# Altium schematic sheet BMC096C.schdoc (part 2 of 3)
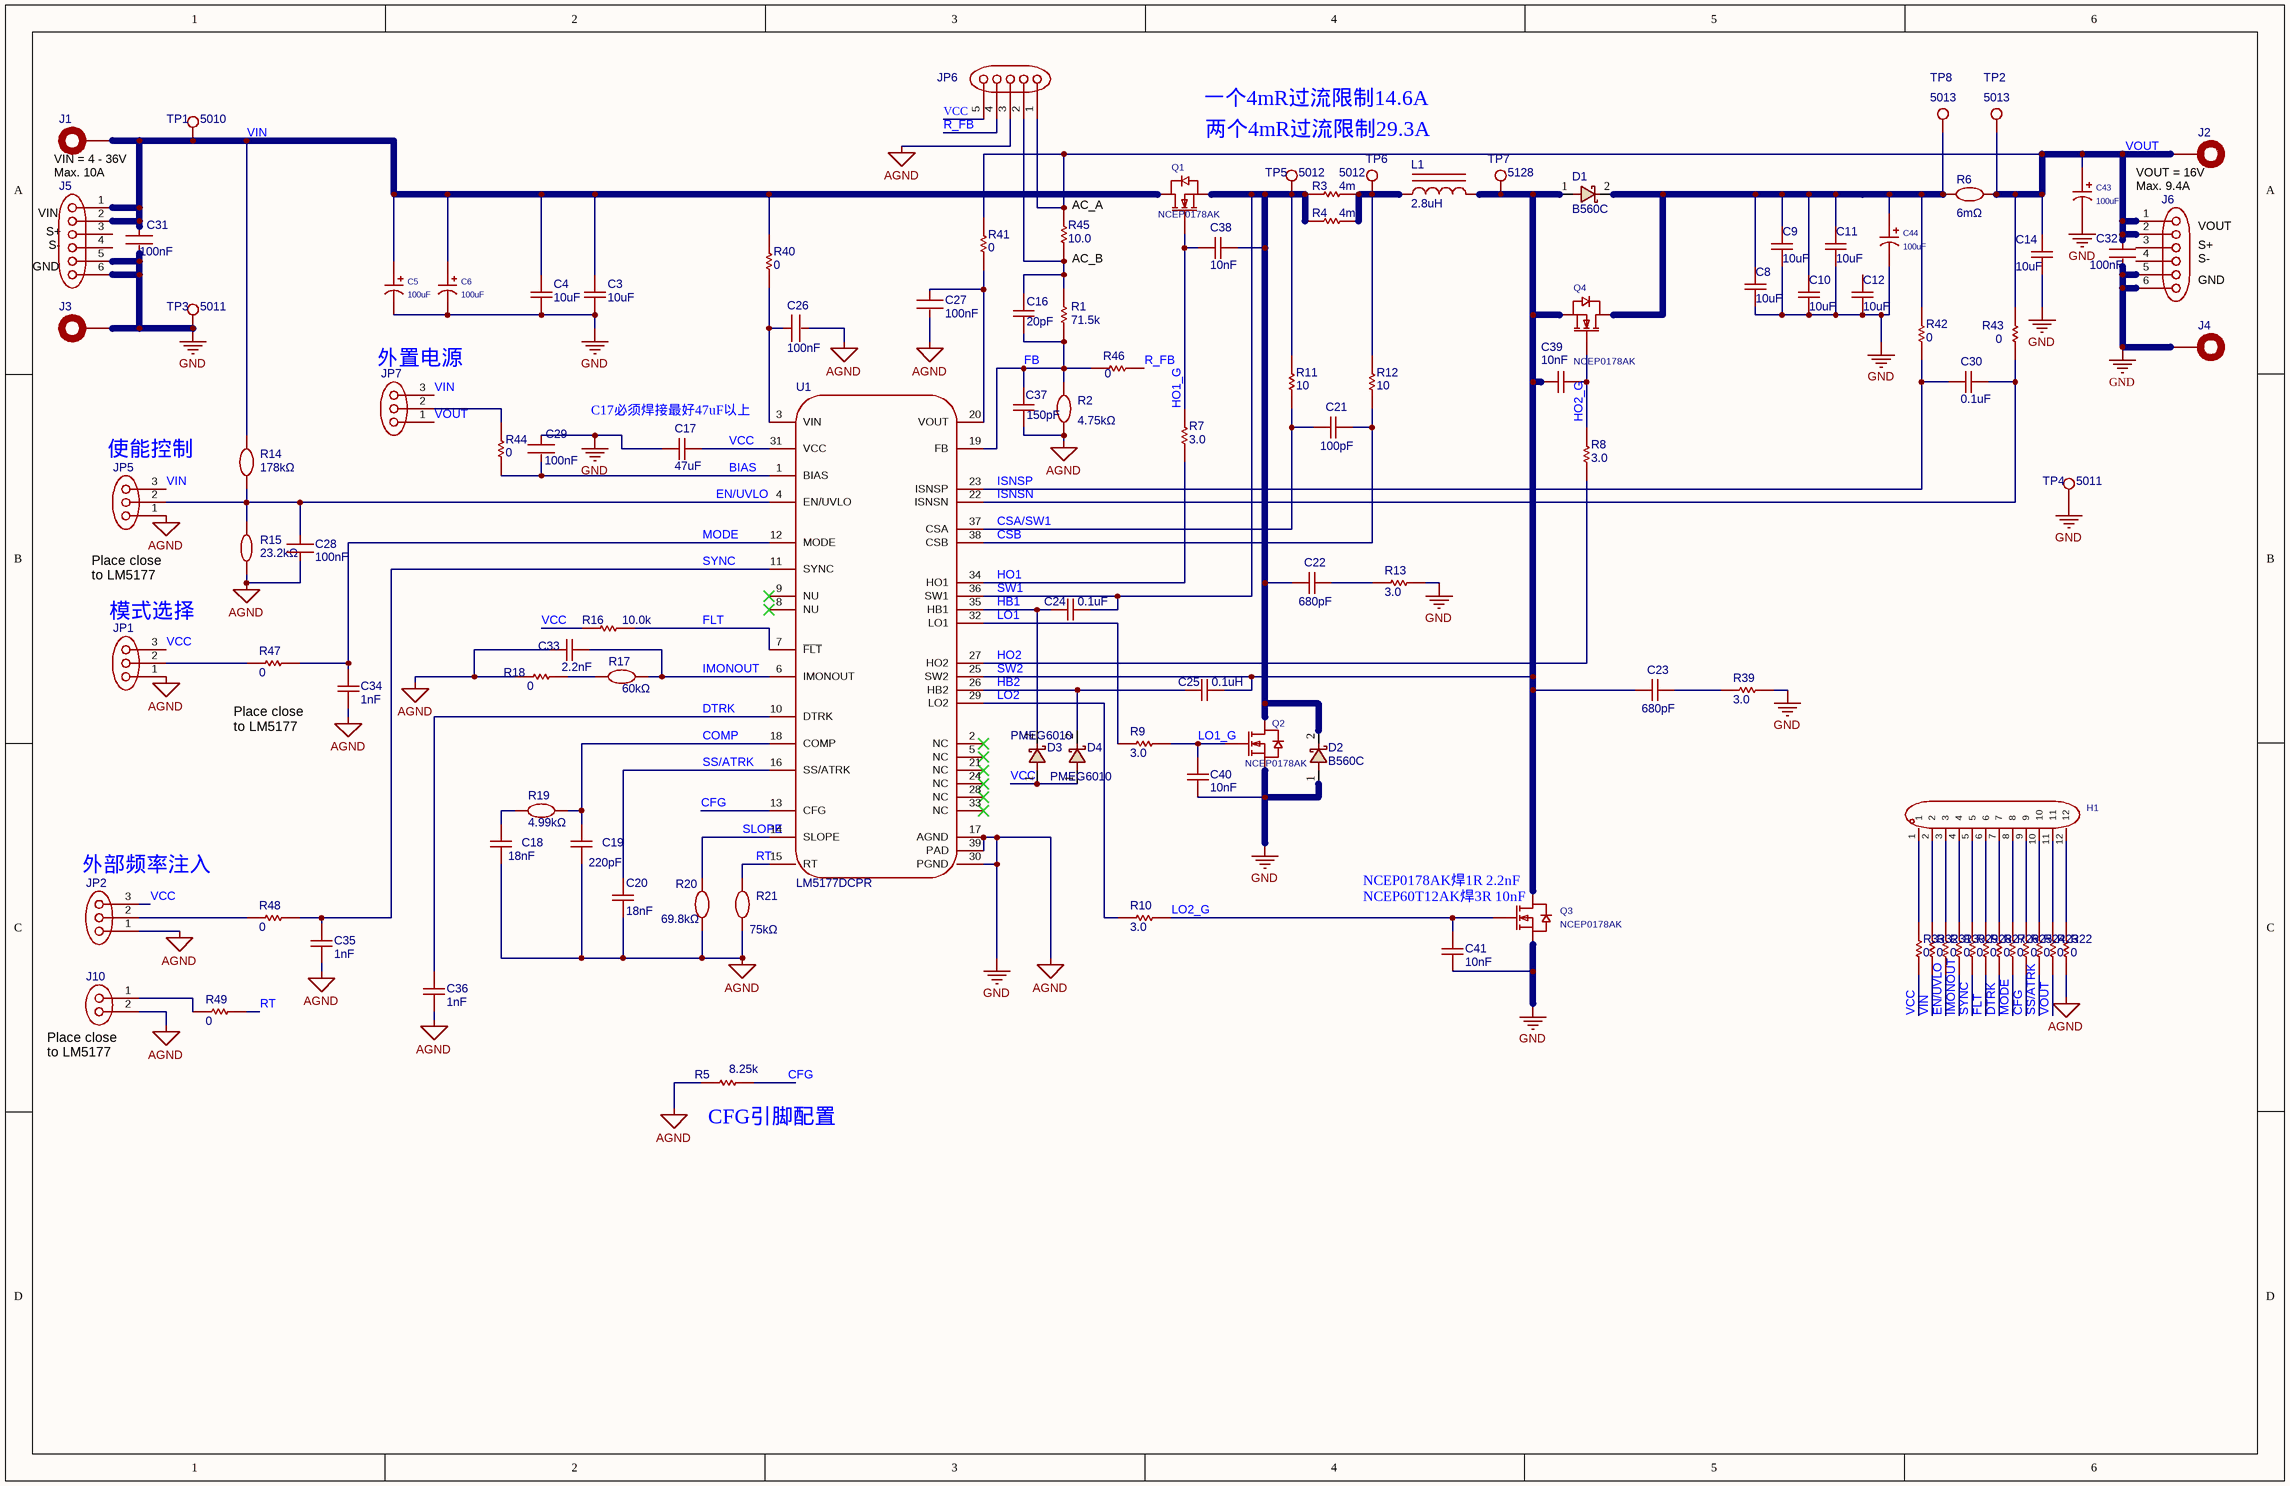
[diagram p1: BMC096C.schdoc]
## Library data of the parts
C3 = CMP-0092251-1: Ceramic Capacitor for Automotive 10uF -10% 50VDC X7S 1210 Embossed T/R; Manufacturer: Murata; AEC Grade: Grade 1; TempCo: 22%; AEC Qualified: Yes; VDC_V: 50V; Cap_F: 10礔; Tolerance_%: 10%; SizeZ_mm: 2.7mm; Value: 10礔; Origin Footprint: FP-GCM32EC71H106KA03L_1210-IPC_C; OriginFootprint 2: FP-GCM32EC71H106KA03L_1210-IPC_B; OriginFootprint 3: FP-GCM32EC71H106KA03L_1210-IPC_A; UniqueId: cc82bf2c2e22e605; OriginModelName: Cap_GCM32EC71H106KA03L_1210; Device: CMP-0092251-1; Symbol: CMP-0092251-1; RoHS: TRUE; ComponentLink1URL: https://www.murata.com/en-us/products/productdetail?partno=GCM32EC71H106KA03%23; Temperature Characteristic: X7S; Part Number: GCM32EC71H106KA03L; PackageReference: 1210; datasheet: https://www.murata.com/en-us/products/productdetail?partno=GCM32EC71H106KA03%23; ComponentLink1Description: Datasheet; helpURL: https://upverter.com/upn/revision/edd6109eef88ffd0/; Operating Temperature Range: -55癈 to +125癈; Datasheet Path: datasheets/Cap-GCM32EC71H106KA03L.pdf; Lead Free: Yes; PartNumber: GCM32EC71H106KA03L; DesignItemID: CMP-0092251-1; LibraryName: Altium Vault - TI; FootprintName: FP-GCM32EC71H106KA03L_1210-MFG; AddInBom: yes
C4 = CMP-0092251-1: Ceramic Capacitor for Automotive 10uF -10% 50VDC X7S 1210 Embossed T/R; Manufacturer: Murata; AEC Grade: Grade 1; TempCo: 22%; AEC Qualified: Yes; VDC_V: 50V; Cap_F: 10礔; Tolerance_%: 10%; SizeZ_mm: 2.7mm; Value: 10礔; Origin Footprint: FP-GCM32EC71H106KA03L_1210-IPC_C; OriginFootprint 2: FP-GCM32EC71H106KA03L_1210-IPC_B; OriginFootprint 3: FP-GCM32EC71H106KA03L_1210-IPC_A; UniqueId: 3a68d3ddabf48558; OriginModelName: Cap_GCM32EC71H106KA03L_1210; Device: CMP-0092251-1; Symbol: CMP-0092251-1; RoHS: TRUE; ComponentLink1URL: https://www.murata.com/en-us/products/productdetail?partno=GCM32EC71H106KA03%23; Temperature Characteristic: X7S; Part Number: GCM32EC71H106KA03L; PackageReference: 1210; datasheet: https://www.murata.com/en-us/products/productdetail?partno=GCM32EC71H106KA03%23; ComponentLink1Description: Datasheet; helpURL: https://upverter.com/upn/revision/edd6109eef88ffd0/; Operating Temperature Range: -55癈 to +125癈; Datasheet Path: datasheets/Cap-GCM32EC71H106KA03L.pdf; Lead Free: Yes; PartNumber: GCM32EC71H106KA03L; DesignItemID: CMP-0092251-1; LibraryName: Altium Vault - TI; FootprintName: FP-GCM32EC71H106KA03L_1210-MFG; AddInBom: yes
C5 C6 = MA63V100M10X10: 容值:100uF;精度:±20%;额定电压:63V;纹波电流:3.1A@100kHz;等效串联电阻(ESR):30mΩ@100kHz;类型:聚合物;; Manufacturer: JIERR(捷而瑞); Tolerance: ±20%; Voltage Rating: 63V; Type: 聚合物; Lifetime: 2000hrs@105℃; Polarity type: 有极性; AddInBom: yes; Symbol: MA63V100M10X10; Device: MA63V100M10X10; LCSC Part Name: 100uF ±20% 63V; Supplier Part: C54321630; Manufacturer Part: MA63V100M10X10; Supplier Footprint: SMD,D10.3xL10.5mm; JLCPCB Part Class: Extended Part; Datasheet: https://item.szlcsc.com/datasheet/MA63V100M10X10/57612373.html; Supplier: LCSC; Value: 100uF; Ripple Current: 3.1A@100kHz; Equivalent Series Resistance(ESR): 30mΩ@100kHz; Diameter: 10mm; Height - Seated (Max): 10mm; Operating Temperature: -55℃~+105℃; ConvertToPcb: yes; FootprintName: CAP-SMD_BD10.0-L10.3-W10.3-LS11.6-FD_H10.5
C8 = CMP-0092251-1: Ceramic Capacitor for Automotive 10uF -10% 50VDC X7S 1210 Embossed T/R; Manufacturer: Murata; AEC Grade: Grade 1; TempCo: 22%; AEC Qualified: Yes; VDC_V: 50V; Cap_F: 10礔; Tolerance_%: 10%; SizeZ_mm: 2.7mm; Value: 10礔; Origin Footprint: FP-GCM32EC71H106KA03L_1210-IPC_C; OriginFootprint 2: FP-GCM32EC71H106KA03L_1210-IPC_B; OriginFootprint 3: FP-GCM32EC71H106KA03L_1210-IPC_A; UniqueId: 80f3708378e3d903; OriginModelName: Cap_GCM32EC71H106KA03L_1210; Device: CMP-0092251-1; Symbol: CMP-0092251-1; RoHS: TRUE; ComponentLink1URL: https://www.murata.com/en-us/products/productdetail?partno=GCM32EC71H106KA03%23; Temperature Characteristic: X7S; Part Number: GCM32EC71H106KA03L; PackageReference: 1210; datasheet: https://www.murata.com/en-us/products/productdetail?partno=GCM32EC71H106KA03%23; ComponentLink1Description: Datasheet; helpURL: https://upverter.com/upn/revision/edd6109eef88ffd0/; Operating Temperature Range: -55癈 to +125癈; Datasheet Path: datasheets/Cap-GCM32EC71H106KA03L.pdf; Lead Free: Yes; PartNumber: GCM32EC71H106KA03L; DesignItemID: CMP-0092251-1; LibraryName: Altium Vault - TI; FootprintName: FP-GCM32EC71H106KA03L_1210-MFG; AddInBom: yes
C9 = CMP-0092251-1: Ceramic Capacitor for Automotive 10uF -10% 50VDC X7S 1210 Embossed T/R; Manufacturer: Murata; AEC Grade: Grade 1; TempCo: 22%; AEC Qualified: Yes; VDC_V: 50V; Cap_F: 10礔; Tolerance_%: 10%; SizeZ_mm: 2.7mm; Value: 10礔; Origin Footprint: FP-GCM32EC71H106KA03L_1210-IPC_C; OriginFootprint 2: FP-GCM32EC71H106KA03L_1210-IPC_B; OriginFootprint 3: FP-GCM32EC71H106KA03L_1210-IPC_A; UniqueId: 7ddfd2f632a8b17d; OriginModelName: Cap_GCM32EC71H106KA03L_1210; Device: CMP-0092251-1; Symbol: CMP-0092251-1; RoHS: TRUE; ComponentLink1URL: https://www.murata.com/en-us/products/productdetail?partno=GCM32EC71H106KA03%23; Temperature Characteristic: X7S; Part Number: GCM32EC71H106KA03L; PackageReference: 1210; datasheet: https://www.murata.com/en-us/products/productdetail?partno=GCM32EC71H106KA03%23; ComponentLink1Description: Datasheet; helpURL: https://upverter.com/upn/revision/edd6109eef88ffd0/; Operating Temperature Range: -55癈 to +125癈; Datasheet Path: datasheets/Cap-GCM32EC71H106KA03L.pdf; Lead Free: Yes; PartNumber: GCM32EC71H106KA03L; DesignItemID: CMP-0092251-1; LibraryName: Altium Vault - TI; FootprintName: FP-GCM32EC71H106KA03L_1210-MFG; AddInBom: yes
C10 = CMP-0092251-1: Ceramic Capacitor for Automotive 10uF -10% 50VDC X7S 1210 Embossed T/R; Manufacturer: Murata; AEC Grade: Grade 1; TempCo: 22%; AEC Qualified: Yes; VDC_V: 50V; Cap_F: 10礔; Tolerance_%: 10%; SizeZ_mm: 2.7mm; Value: 10礔; Origin Footprint: FP-GCM32EC71H106KA03L_1210-IPC_C; OriginFootprint 2: FP-GCM32EC71H106KA03L_1210-IPC_B; OriginFootprint 3: FP-GCM32EC71H106KA03L_1210-IPC_A; UniqueId: 3e75135af30e0f04; OriginModelName: Cap_GCM32EC71H106KA03L_1210; Device: CMP-0092251-1; Symbol: CMP-0092251-1; RoHS: TRUE; ComponentLink1URL: https://www.murata.com/en-us/products/productdetail?partno=GCM32EC71H106KA03%23; Temperature Characteristic: X7S; Part Number: GCM32EC71H106KA03L; PackageReference: 1210; datasheet: https://www.murata.com/en-us/products/productdetail?partno=GCM32EC71H106KA03%23; ComponentLink1Description: Datasheet; helpURL: https://upverter.com/upn/revision/edd6109eef88ffd0/; Operating Temperature Range: -55癈 to +125癈; Datasheet Path: datasheets/Cap-GCM32EC71H106KA03L.pdf; Lead Free: Yes; PartNumber: GCM32EC71H106KA03L; DesignItemID: CMP-0092251-1; LibraryName: Altium Vault - TI; FootprintName: FP-GCM32EC71H106KA03L_1210-MFG; AddInBom: yes
C11 = CMP-0092251-1: Ceramic Capacitor for Automotive 10uF -10% 50VDC X7S 1210 Embossed T/R; Manufacturer: Murata; AEC Grade: Grade 1; TempCo: 22%; AEC Qualified: Yes; VDC_V: 50V; Cap_F: 10礔; Tolerance_%: 10%; SizeZ_mm: 2.7mm; Value: 10礔; Origin Footprint: FP-GCM32EC71H106KA03L_1210-IPC_C; OriginFootprint 2: FP-GCM32EC71H106KA03L_1210-IPC_B; OriginFootprint 3: FP-GCM32EC71H106KA03L_1210-IPC_A; UniqueId: 20764de07767b3a1; OriginModelName: Cap_GCM32EC71H106KA03L_1210; Device: CMP-0092251-1; Symbol: CMP-0092251-1; RoHS: TRUE; ComponentLink1URL: https://www.murata.com/en-us/products/productdetail?partno=GCM32EC71H106KA03%23; Temperature Characteristic: X7S; Part Number: GCM32EC71H106KA03L; PackageReference: 1210; datasheet: https://www.murata.com/en-us/products/productdetail?partno=GCM32EC71H106KA03%23; ComponentLink1Description: Datasheet; helpURL: https://upverter.com/upn/revision/edd6109eef88ffd0/; Operating Temperature Range: -55癈 to +125癈; Datasheet Path: datasheets/Cap-GCM32EC71H106KA03L.pdf; Lead Free: Yes; PartNumber: GCM32EC71H106KA03L; DesignItemID: CMP-0092251-1; LibraryName: Altium Vault - TI; FootprintName: FP-GCM32EC71H106KA03L_1210-MFG; AddInBom: yes
C12 = CMP-0092251-1: Ceramic Capacitor for Automotive 10uF -10% 50VDC X7S 1210 Embossed T/R; Manufacturer: Murata; AEC Grade: Grade 1; TempCo: 22%; AEC Qualified: Yes; VDC_V: 50V; Cap_F: 10礔; Tolerance_%: 10%; SizeZ_mm: 2.7mm; Value: 10礔; Origin Footprint: FP-GCM32EC71H106KA03L_1210-IPC_C; OriginFootprint 2: FP-GCM32EC71H106KA03L_1210-IPC_B; OriginFootprint 3: FP-GCM32EC71H106KA03L_1210-IPC_A; UniqueId: 26a39bcafcc8ce7c; OriginModelName: Cap_GCM32EC71H106KA03L_1210; Device: CMP-0092251-1; Symbol: CMP-0092251-1; RoHS: TRUE; ComponentLink1URL: https://www.murata.com/en-us/products/productdetail?partno=GCM32EC71H106KA03%23; Temperature Characteristic: X7S; Part Number: GCM32EC71H106KA03L; PackageReference: 1210; datasheet: https://www.murata.com/en-us/products/productdetail?partno=GCM32EC71H106KA03%23; ComponentLink1Description: Datasheet; helpURL: https://upverter.com/upn/revision/edd6109eef88ffd0/; Operating Temperature Range: -55癈 to +125癈; Datasheet Path: datasheets/Cap-GCM32EC71H106KA03L.pdf; Lead Free: Yes; PartNumber: GCM32EC71H106KA03L; DesignItemID: CMP-0092251-1; LibraryName: Altium Vault - TI; FootprintName: FP-GCM32EC71H106KA03L_1210-MFG; AddInBom: yes
C14 = CMP-0092251-1: Ceramic Capacitor for Automotive 10uF -10% 50VDC X7S 1210 Embossed T/R; Manufacturer: Murata; AEC Grade: Grade 1; TempCo: 22%; AEC Qualified: Yes; VDC_V: 50V; Cap_F: 10礔; Tolerance_%: 10%; SizeZ_mm: 2.7mm; Value: 10礔; Origin Footprint: FP-GCM32EC71H106KA03L_1210-IPC_C; OriginFootprint 2: FP-GCM32EC71H106KA03L_1210-IPC_B; OriginFootprint 3: FP-GCM32EC71H106KA03L_1210-IPC_A; UniqueId: 00361082df9d4549; OriginModelName: Cap_GCM32EC71H106KA03L_1210; Device: CMP-0092251-1; Symbol: CMP-0092251-1; RoHS: TRUE; ComponentLink1URL: https://www.murata.com/en-us/products/productdetail?partno=GCM32EC71H106KA03%23; Temperature Characteristic: X7S; Part Number: GCM32EC71H106KA03L; PackageReference: 1210; datasheet: https://www.murata.com/en-us/products/productdetail?partno=GCM32EC71H106KA03%23; ComponentLink1Description: Datasheet; helpURL: https://upverter.com/upn/revision/edd6109eef88ffd0/; Operating Temperature Range: -55癈 to +125癈; Datasheet Path: datasheets/Cap-GCM32EC71H106KA03L.pdf; Lead Free: Yes; PartNumber: GCM32EC71H106KA03L; DesignItemID: CMP-0092251-1; LibraryName: Altium Vault - TI; FootprintName: FP-GCM32EC71H106KA03L_1210-MFG; AddInBom: yes
C16 = CMP-0007253-4: CAP, CERM, 20 pF, 100 V, +/- 5%, C0G/NP0, 0603; Manufacturer: MuRata; TaMin_C: -55癈; Polarized: N; SizeAreaWB_mm2: 4.68; Value1: Unknown; U/M: EA; Value: 20pF; TaMax_C: 125癈; SizeZ_mm: 1; SizeX_mm: 1.6; SizeY_mm: 0.8; Cap_Case: 0603; Value2: 100V; SizeArea_mm2: 1.28; CompType: Capacitor; AEC Category: Q200; OriginFootprint 2: 0603_HV; OriginFootprint 3: 0603L; OriginFootprint 4: 0603M; UniqueId: c8e923f96b539988; AddInBom: yes; Device: CMP-0007253-4; Symbol: CMP-0007253-4; Supplier Part Number 2: 81-GRM1885C2A200JA1D; Publisher: Texas Instruments; Supplier 2: Mouser; TempCo: C0G/NP0; Published: 2008-06-19; RoHS: Y; MountType: SMT; Supplier 1: Digi-Key; PackageReference: 0603; Tolerance_%: 5%; LatestRevisionDate: 2017-03-09; PartNumber: GRM1885C2A200JA01D; AEC Qualified: ?; Cap_F: 20pF; VDC_V: 100V; ComponentLink1Description: Datasheet link; Supplier Part Number 1: 490-1334-1-ND; Technology: Ceramic; ComponentLink1URL: http://search.murata.co.jp/Ceramy/PnsearchViewAction.do?HnOFG=ON&HnNFG=ON&SEL_CNT=50&sLang=en&sKey=GRM1885C2A200JA01D&x=9&y=9&search=startwith; Origin Footprint: 0603; DesignItemID: CMP-0007253-4; LibraryName: Altium Vault - TI; FootprintName: 0603S
C17 = CMP-0007313-5: CAP, CERM, 47 uF, 6.3 V, +/- 20%, X5R, 0603; Manufacturer: MuRata; TaMin_C: -55癈; Polarized: N; SizeAreaWB_mm2: 4.68; Value1: Unknown; U/M: EA; Value: 47uF; TaMax_C: 85癈; SizeZ_mm: 1; SizeX_mm: 1.6; SizeY_mm: 0.8; Cap_Case: 0603; Value2: 6.3V; SizeArea_mm2: 1.28; CompType: Capacitor; Cap_F: 47礔; AEC Category: Q200; OriginFootprint 2: 0603_HV; OriginFootprint 3: 0603L; OriginFootprint 4: 0603M; UniqueId: 48700c84863a802e; AddInBom: yes; Device: CMP-0007313-5; Symbol: CMP-0007313-5; Publisher: Texas Instruments; TempCo: X5R; Published: 2008-06-19; RoHS: Y; MountType: SMT; PackageReference: 0603; Tolerance_%: 20%; LatestRevisionDate: 2017-03-09; PartNumber: GRM188R60J476ME15D; AEC Qualified: ?; VDC_V: 6.3V; ComponentLink1Description: Datasheet link; Technology: Ceramic; ComponentLink1URL: http://psearch.en.murata.com/capacitor/product/GRM188R60J476ME15%23.pdf; Origin Footprint: 0603; DesignItemID: CMP-0007313-5; LibraryName: Altium Vault - TI; FootprintName: 0603S
C18 = CC0603KRX7R9BB183: 容值:18nF;精度:±10%;额定电压:50V;温度系数:X7R;; Manufacturer: YAGEO(国巨); Add into BOM: yes; 3D Model: ac125912035d415993ca9572d50418b1; 3D Model Transform: 62.992,31.496,0,0,0,0,0,0,0; Tolerance: ±10%; Voltage Rating: 50V; Temperature Coefficient: X7R; ModelName: C0603_L1.6-W0.8-H0.8; Symbol: CC0603KRX7R9BB183; Device: CC0603KRX7R9BB183; Convert to PCB: yes; Value: 18nF; LCSC Part Name: 18nF ±10% 50V; Supplier Part: C107079; Manufacturer Part: CC0603KRX7R9BB183; Supplier Footprint: 0603; JLCPCB Part Class: Extended Part; Datasheet: https://item.szlcsc.com/datasheet/CC0603KRX7R9BB183/108295.html; Supplier: LCSC; FootprintName: C0603
C19 = CC0603JRNPO9BN221: 容值:220pF;精度:±5%;额定电压:50V;温度系数:NP0;; Manufacturer: YAGEO(国巨); Add into BOM: yes; 3D Model: ac125912035d415993ca9572d50418b1; 3D Model Transform: 62.992,31.496,0,0,0,0,0,0,0; Tolerance: ±5%; Voltage Rating: 50V; Temperature Coefficient: NP0; ModelName: C0603_L1.6-W0.8-H0.8; Symbol: CC0603JRNPO9BN221; Device: CC0603JRNPO9BN221; Convert to PCB: yes; Value: 220pF; LCSC Part Name: 220pF ±5% 50V; Supplier Part: C106210; Manufacturer Part: CC0603JRNPO9BN221; Supplier Footprint: 0603; JLCPCB Part Class: Extended Part; Datasheet: https://item.szlcsc.com/datasheet/CC0603JRNPO9BN221/107425.html; Supplier: LCSC; FootprintName: C0603
C20 = CMP-0092440-1: Ceramic Capacitor for Automotive 18nF -5% 50VDC C0G 0805 Embossed T/R; Manufacturer: Murata; TempCo: 30ppm/癈; AEC Qualified: Yes; Tolerance_%: 5%; AEC Grade: Grade 1; VDC_V: 50V; SizeZ_mm: 1.4mm; Origin Footprint: FP-GCM21B5C1H183JA16L_0805-IPC_C; OriginFootprint 2: FP-GCM21B5C1H183JA16L_0805-IPC_B; OriginFootprint 3: FP-GCM21B5C1H183JA16L_0805-IPC_A; UniqueId: 97d7532320e593d5; OriginModelName: Cap_GCM21B5C1H183JA16L_0805; Device: CMP-0092440-1; Symbol: CMP-0092440-1; Operating Temperature Range: -55癈 to +125癈; ComponentLink1URL: https://www.murata.com/en-us/products/productdetail?partno=GCM21B5C1H183JA16%23; datasheet: https://www.murata.com/en-us/products/productdetail?partno=GCM21B5C1H183JA16%23; PackageReference: 0805; PartNumber: GCM21B5C1H183JA16L; Part Number: GCM21B5C1H183JA16L; Temperature Characteristic: C0G; ComponentLink1Description: Datasheet; RoHS: TRUE; Cap_F: 18nF; Value: 18nF; Lead Free: Yes; Datasheet Path: datasheets/Cap-GCM21B5C1H183JA16L.pdf; helpURL: https://upverter.com/upn/revision/286cb77b29c01871/; DesignItemID: CMP-0092440-1; LibraryName: Altium Vault - TI; FootprintName: FP-GCM21B5C1H183JA16L_0805-MFG; AddInBom: yes
C21 = CMP-0750041-1: CAP, CERM, 100 pF, 50 V,+/- 5%, C0G/NP0, AEC-Q200 Grade 1, 0603; Manufacturer: MuRata; AEC Grade: 1; SizeArea_mm2: 1.28; SizeX_mm: 1.6; Polarized: N; Cap_Case: 0603; TaMax_C: 125癈; Value2: 50V; Value: 100pF; U/M: EA; CompType: Capacitor; AEC Qualified: Y; SizeAreaWB_mm2: 4.68; TaMin_C: -55癈; SizeY_mm: 0.8; AEC Category: Q200; OriginFootprint 2: 0603M; OriginFootprint 3: 0603L; OriginFootprint 4: 0603_HV; UniqueId: 0259cc883dd91c7a; AddInBom: yes; Device: CMP-0750041-1; Symbol: CMP-0750041-1; SizeZ_mm: 1; TempCo: C0G/NP0; PackageReference: 0603; Tolerance_%: 5%; VDC_V: 50V; Technology: Ceramic; MountType: SMT; RoHS: Y; ComponentLink1Description: Datasheet link; ComponentLink1URL: https://psearch.en.murata.com/capacitor/product/GCM1885C1H101JA16%23.pdf; Cap_F: 100pF; PartNumber: GCM1885C1H101JA16J; Origin Footprint: 0603; DesignItemID: CMP-0750041-1; LibraryName: Altium Vault - TI; FootprintName: 0603S
C22 = CMP-0008089-2: CAP, CERM, 680 pF, 50 V, +/- 5%, C0G/NP0, 0805; Manufacturer: MuRata; TaMin_C: -55癈; Polarized: N; SizeAreaWB_mm2: 6.75; Value1: Unknown; U/M: EA; Value: 680pF; TaMax_C: 125癈; SizeZ_mm: 1.45; SizeX_mm: 2; SizeY_mm: 1.25; Cap_Case: 0805; Value2: 50V; SizeArea_mm2: 2.5; CompType: Capacitor; AEC Category: Q200; Origin Footprint: 0805_HV; OriginFootprint 2: 0805M; OriginFootprint 4: 0805L; UniqueId: 7f35450ac3171d20; AddInBom: yes; Device: CMP-0008089-2; Symbol: CMP-0008089-2; Supplier Part Number 2: 81-GRM40C681J50D; Publisher: Texas Instruments; Supplier 2: Mouser; TempCo: C0G/NP0; Published: 2008-06-19; RoHS: Y; MountType: SMT; Supplier 1: Digi-Key; PackageReference: 0805; Tolerance_%: 5%; LatestRevisionDate: 2017-03-09; PartNumber: GRM2165C1H681JA01D; AEC Qualified: ?; Cap_F: 680pF; VDC_V: 50V; ComponentLink1Description: Datasheet link; Supplier Part Number 1: 490-1619-1-ND; Technology: Ceramic; ComponentLink1URL: http://search.murata.co.jp/Ceramy/PnsearchViewAction.do?HnOFG=ON&HnNFG=ON&SEL_CNT=50&sLang=en&sKey=GRM2165C1H681JA01D&x=9&y=9&search=startwith; OriginFootprint 3: 0805; DesignItemID: CMP-0008089-2; LibraryName: Altium Vault - TI; FootprintName: 0805_HV1
C23 = CMP-0008089-2: CAP, CERM, 680 pF, 50 V, +/- 5%, C0G/NP0, 0805; Manufacturer: MuRata; TaMin_C: -55癈; Polarized: N; SizeAreaWB_mm2: 6.75; Value1: Unknown; U/M: EA; Value: 680pF; TaMax_C: 125癈; SizeZ_mm: 1.45; SizeX_mm: 2; SizeY_mm: 1.25; Cap_Case: 0805; Value2: 50V; SizeArea_mm2: 2.5; CompType: Capacitor; AEC Category: Q200; Origin Footprint: 0805_HV; OriginFootprint 2: 0805M; OriginFootprint 4: 0805L; UniqueId: 8bc5c1e1749a19fa; AddInBom: yes; Device: CMP-0008089-2; Symbol: CMP-0008089-2; Supplier Part Number 2: 81-GRM40C681J50D; Publisher: Texas Instruments; Supplier 2: Mouser; TempCo: C0G/NP0; Published: 2008-06-19; RoHS: Y; MountType: SMT; Supplier 1: Digi-Key; PackageReference: 0805; Tolerance_%: 5%; LatestRevisionDate: 2017-03-09; PartNumber: GRM2165C1H681JA01D; AEC Qualified: ?; Cap_F: 680pF; VDC_V: 50V; ComponentLink1Description: Datasheet link; Supplier Part Number 1: 490-1619-1-ND; Technology: Ceramic; ComponentLink1URL: http://search.murata.co.jp/Ceramy/PnsearchViewAction.do?HnOFG=ON&HnNFG=ON&SEL_CNT=50&sLang=en&sKey=GRM2165C1H681JA01D&x=9&y=9&search=startwith; OriginFootprint 3: 0805; DesignItemID: CMP-0008089-2; LibraryName: Altium Vault - TI; FootprintName: 0805_HV1
C24 = CMP-0860983-1: CAP, CERM, 0.1 礔, 50 V,+/- 10%, X7R, 0402; Manufacturer: Passive Plus; Cap_Case: 0402; TaMax_C: 125癈; VDC_V: 50V; U/M: EA; CompType: Capacitor; SizeY_mm: 0.5; TaMin_C: -55癈; SizeAreaWB_mm2: 3; Value: 0.1uF; AEC Qualified: N; SizeX_mm: 1; AEC Category: Q200; SizeZ_mm: 0.6; Cap_F: 100nF; OriginFootprint 2: 0402M; OriginFootprint 3: 0402L; UniqueId: 7c674fedd66d7165; AddInBom: yes; Device: CMP-0860983-1; Symbol: CMP-0860983-1; RoHS: Y; PackageReference: 0402; AEC Grade: N/A; Technology: Ceramic; TempCo: X7R; ComponentLink1Description: Datasheet link; PartNumber: 0402BB104KW500; SizeArea_mm2: 0.5; MountType: SMT; Tolerance_%: 10%; ComponentLink1URL: https://www.passiveplus.com/pdf/PPI-0402BB104-KW500.DATASHEET.pdf; Polarized: N; Value2: 50V; Origin Footprint: 0402; DesignItemID: CMP-0860983-1; LibraryName: Altium Vault - TI; FootprintName: 0402S
C25 = CMP-0860983-1: CAP, CERM, 0.1 uF, 50 V,+/- 10%, X7R, 0402; Manufacturer: Passive Plus; Cap_Case: 0402; TaMax_C: 125癈; VDC_V: 50V; U/M: EA; CompType: Capacitor; SizeY_mm: 0.5; TaMin_C: -55癈; SizeAreaWB_mm2: 3; Value: 0.1uF; AEC Qualified: N; SizeX_mm: 1; AEC Category: Q200; SizeZ_mm: 0.6; Cap_F: 100nF; OriginFootprint 2: 0402M; OriginFootprint 3: 0402L; UniqueId: d99985aa138ce050; AddInBom: yes; Device: CMP-0860983-1; Symbol: CMP-0860983-1; RoHS: Y; PackageReference: 0402; AEC Grade: N/A; Technology: Ceramic; TempCo: X7R; ComponentLink1Description: Datasheet link; PartNumber: 0402BB104KW500; SizeArea_mm2: 0.5; MountType: SMT; Tolerance_%: 10%; ComponentLink1URL: https://www.passiveplus.com/pdf/PPI-0402BB104-KW500.DATASHEET.pdf; Polarized: N; Value2: 50V; Origin Footprint: 0402; DesignItemID: CMP-0860983-1; LibraryName: Altium Vault - TI; FootprintName: 0402S
C26 C27 = CMP-0086535-1: 0.1uF -10% 50V Ceramic Capacitor X8L 0603 (1608 Metric); Manufacturer: Murata Electronics North America; Symbol Name: SYM-GCM188L81H104KA57D; Tolerance_%: 10%; AEC Qualified: Yes; TempCo: -40+15%; SizeZ_mm: 0.9mm; AEC Grade: Grade 0; Origin Footprint: FP-GCM188L81H104KA57D_0603-IPC_C; OriginFootprint 2: FP-GCM188L81H104KA57D_0603-IPC_B; OriginFootprint 3: FP-GCM188L81H104KA57D_0603-IPC_A; UniqueId: b4693cfd16d534cd; OriginModelName: Cap_GCM188L81H104KA57D_0603; Device: CMP-0086535-1; Symbol: CMP-0086535-1; RoHS: TRUE; PackageReference: 0603; ComponentLink1URL: https://search.murata.co.jp/Ceramy/image/img/A01X/G101/ENG/GCM188L81H104KA57-01.pdf; PartNumber: GCM188L81H104KA57D; ComponentLink1Description: Datasheet; VDC_V: 50V; DesignItemID: CMP-0086535-1; LibraryName: Altium Vault - TI; FootprintName: FP-GCM188L81H104KA57D_0603-MFG; AddInBom: yes
C28 = CMP-0086535-1: 0.1礔 -10% 50V Ceramic Capacitor X8L 0603 (1608 Metric); Manufacturer: Murata Electronics North America; Symbol Name: SYM-GCM188L81H104KA57D; Tolerance_%: 10%; AEC Qualified: Yes; TempCo: -40+15%; SizeZ_mm: 0.9mm; AEC Grade: Grade 0; Origin Footprint: FP-GCM188L81H104KA57D_0603-IPC_C; OriginFootprint 2: FP-GCM188L81H104KA57D_0603-IPC_B; OriginFootprint 3: FP-GCM188L81H104KA57D_0603-IPC_A; UniqueId: e3aeb17489c0ab5d; OriginModelName: Cap_GCM188L81H104KA57D_0603; Device: CMP-0086535-1; Symbol: CMP-0086535-1; RoHS: TRUE; PackageReference: 0603; ComponentLink1URL: https://search.murata.co.jp/Ceramy/image/img/A01X/G101/ENG/GCM188L81H104KA57-01.pdf; PartNumber: GCM188L81H104KA57D; ComponentLink1Description: Datasheet; VDC_V: 50V; DesignItemID: CMP-0086535-1; LibraryName: Altium Vault - TI; FootprintName: FP-GCM188L81H104KA57D_0603-MFG; AddInBom: yes
C29 = CMP-0086535-1: 0.1礔 -10% 50V Ceramic Capacitor X8L 0603 (1608 Metric); Manufacturer: Murata Electronics North America; Symbol Name: SYM-GCM188L81H104KA57D; Tolerance_%: 10%; AEC Qualified: Yes; TempCo: -40+15%; SizeZ_mm: 0.9mm; AEC Grade: Grade 0; Origin Footprint: FP-GCM188L81H104KA57D_0603-IPC_C; OriginFootprint 2: FP-GCM188L81H104KA57D_0603-IPC_B; OriginFootprint 3: FP-GCM188L81H104KA57D_0603-IPC_A; UniqueId: 5bfcee5f0e3d202c; OriginModelName: Cap_GCM188L81H104KA57D_0603; Device: CMP-0086535-1; Symbol: CMP-0086535-1; RoHS: TRUE; PackageReference: 0603; ComponentLink1URL: https://search.murata.co.jp/Ceramy/image/img/A01X/G101/ENG/GCM188L81H104KA57-01.pdf; PartNumber: GCM188L81H104KA57D; ComponentLink1Description: Datasheet; VDC_V: 50V; DesignItemID: CMP-0086535-1; LibraryName: Altium Vault - TI; FootprintName: FP-GCM188L81H104KA57D_0603-MFG; AddInBom: yes
C30 = CMP-0860983-1: CAP, CERM, 0.1 礔, 50 V,+/- 10%, X7R, 0402; Manufacturer: Passive Plus; Cap_Case: 0402; TaMax_C: 125癈; VDC_V: 50V; U/M: EA; CompType: Capacitor; SizeY_mm: 0.5; TaMin_C: -55癈; SizeAreaWB_mm2: 3; Value: 0.1uF; AEC Qualified: N; SizeX_mm: 1; AEC Category: Q200; SizeZ_mm: 0.6; Cap_F: 100nF; OriginFootprint 2: 0402M; OriginFootprint 3: 0402L; UniqueId: a2ee6ceb65d30336; AddInBom: yes; Device: CMP-0860983-1; Symbol: CMP-0860983-1; RoHS: Y; PackageReference: 0402; AEC Grade: N/A; Technology: Ceramic; TempCo: X7R; ComponentLink1Description: Datasheet link; PartNumber: 0402BB104KW500; SizeArea_mm2: 0.5; MountType: SMT; Tolerance_%: 10%; ComponentLink1URL: https://www.passiveplus.com/pdf/PPI-0402BB104-KW500.DATASHEET.pdf; Polarized: N; Value2: 50V; Origin Footprint: 0402; DesignItemID: CMP-0860983-1; LibraryName: Altium Vault - TI; FootprintName: 0402S
C31 = CMP-0086535-1: 0.1礔 -10% 50V Ceramic Capacitor X8L 0603 (1608 Metric); Manufacturer: Murata Electronics North America; Symbol Name: SYM-GCM188L81H104KA57D; Tolerance_%: 10%; AEC Qualified: Yes; TempCo: -40+15%; SizeZ_mm: 0.9mm; AEC Grade: Grade 0; Origin Footprint: FP-GCM188L81H104KA57D_0603-IPC_C; OriginFootprint 2: FP-GCM188L81H104KA57D_0603-IPC_B; OriginFootprint 3: FP-GCM188L81H104KA57D_0603-IPC_A; Origin 3D Model Title: Cap_GCM188L81H104KA57D_0603; Device: CMP-0086535-1; Symbol: CMP-0086535-1; RoHS: TRUE; PackageReference: 0603; ComponentLink1URL: https://search.murata.co.jp/Ceramy/image/img/A01X/G101/ENG/GCM188L81H104KA57-01.pdf; PartNumber: GCM188L81H104KA57D; ComponentLink1Description: Datasheet; VDC_V: 50V; DesignItemID: CMP-0086535-1; LibraryName: Altium Vault - TI; FootprintName: FP-GCM188L81H104KA57D_0603-MFG; AddInBom: yes
C32 = CMP-0086535-1: 0.1礔 -10% 50V Ceramic Capacitor X8L 0603 (1608 Metric); Manufacturer: Murata Electronics North America; Symbol Name: SYM-GCM188L81H104KA57D; Tolerance_%: 10%; AEC Qualified: Yes; TempCo: -40+15%; SizeZ_mm: 0.9mm; AEC Grade: Grade 0; Origin Footprint: FP-GCM188L81H104KA57D_0603-IPC_C; OriginFootprint 2: FP-GCM188L81H104KA57D_0603-IPC_B; OriginFootprint 3: FP-GCM188L81H104KA57D_0603-IPC_A; UniqueId: d2625f4b4bd439ef; OriginModelName: Cap_GCM188L81H104KA57D_0603; Device: CMP-0086535-1; Symbol: CMP-0086535-1; RoHS: TRUE; PackageReference: 0603; ComponentLink1URL: https://search.murata.co.jp/Ceramy/image/img/A01X/G101/ENG/GCM188L81H104KA57-01.pdf; PartNumber: GCM188L81H104KA57D; ComponentLink1Description: Datasheet; VDC_V: 50V; DesignItemID: CMP-0086535-1; LibraryName: Altium Vault - TI; FootprintName: FP-GCM188L81H104KA57D_0603-MFG; AddInBom: yes
C33 = CMP-0006736-4: CAP, CERM, 2200 pF, 100 V, +/- 5%, X7R, 0603; Manufacturer: AVX; TaMin_C: -55癈; ESR_ohm: 0.192; Polarized: N; SizeAreaWB_mm2: 4.68; Value1: 0.192 ohm; U/M: EA; Value: 2200pF; TaMax_C: 125癈; SizeZ_mm: 1; SizeX_mm: 1.6; SizeY_mm: 0.8; Cap_Case: 0603; Value2: 100V; SizeArea_mm2: 1.28; CompType: Capacitor; AEC Category: Q200; OriginFootprint 2: 0603_HV; OriginFootprint 3: 0603L; OriginFootprint 4: 0603M; UniqueId: deb55bbe20a101cf; AddInBom: yes; Device: CMP-0006736-4; Symbol: CMP-0006736-4; Supplier Part Number 2: 96M1245; Publisher: Texas Instruments; Supplier 2: Newark; Supplier Part Number 3: 581-06031C222J; TempCo: X7R; Supplier 3: Mouser; Published: 2008-06-19; RoHS: Y; MountType: SMT; Supplier 1: Digi-Key; PackageReference: 0603; Tolerance_%: 5%; LatestRevisionDate: 2017-03-09; PartNumber: 06031C222JAT2A; AEC Qualified: N; VDC_V: 100V; ComponentLink1Description: Datasheet link; AEC Grade: N/A; Supplier Part Number 1: 478-3705-1-ND; Technology: Ceramic; ValueDisplayed: 2200pF; ComponentLink1URL: http://datasheets.avx.com/X7RDielectric.pdf; Origin Footprint: 0603; DesignItemID: CMP-0006736-4; LibraryName: Altium Vault - TI; FootprintName: 0603S
C34 = CMP-0006723-4: CAP, CERM, 1000 pF, 100 V, +/- 5%, X7R, 0603; Manufacturer: AVX; TaMin_C: -55癈; ESR_ohm: 2.76d; Polarized: N; SizeAreaWB_mm2: 4.68; Value1: 0.276 ohm; U/M: EA; Value: 1000pF; TaMax_C: 125癈; SizeZ_mm: 1; SizeX_mm: 1.6; SizeY_mm: 0.8; Cap_Case: 0603; Value2: 100V; SizeArea_mm2: 1.28; CompType: Capacitor; AEC Category: Q200; OriginFootprint 2: 0603_HV; OriginFootprint 3: 0603L; OriginFootprint 4: 0603M; UniqueId: 553def7d7947fca6; AddInBom: yes; Device: CMP-0006723-4; Symbol: CMP-0006723-4; Supplier Part Number 2: 96M1234; Publisher: Texas Instruments; Supplier 2: Newark; Supplier Part Number 3: 581-06031C102J; TempCo: X7R; Supplier 3: Mouser; Published: 2008-06-19; RoHS: Y; MountType: SMT; Supplier 1: Digi-Key; PackageReference: 0603; Tolerance_%: 5%; LatestRevisionDate: 2017-03-09; PartNumber: 06031C102JAT2A; AEC Qualified: N; VDC_V: 100V; ComponentLink1Description: Datasheet link; AEC Grade: N/A; Supplier Part Number 1: 478-3698-1-ND; Technology: Ceramic; ValueDisplayed: 1000pF; ComponentLink1URL: http://datasheets.avx.com/X7RDielectric.pdf; Origin Footprint: 0603; DesignItemID: CMP-0006723-4; LibraryName: Altium Vault - TI; FootprintName: 0603S
C35 = CMP-0006723-4: CAP, CERM, 1000 pF, 100 V, +/- 5%, X7R, 0603; Manufacturer: AVX; TaMin_C: -55癈; ESR_ohm: 2.76d; Polarized: N; SizeAreaWB_mm2: 4.68; Value1: 0.276 ohm; U/M: EA; Value: 1000pF; TaMax_C: 125癈; SizeZ_mm: 1; SizeX_mm: 1.6; SizeY_mm: 0.8; Cap_Case: 0603; Value2: 100V; SizeArea_mm2: 1.28; CompType: Capacitor; AEC Category: Q200; OriginFootprint 2: 0603_HV; OriginFootprint 3: 0603L; OriginFootprint 4: 0603M; UniqueId: 2b4e6e580c7acde0; AddInBom: yes; Device: CMP-0006723-4; Symbol: CMP-0006723-4; Supplier Part Number 2: 96M1234; Publisher: Texas Instruments; Supplier 2: Newark; Supplier Part Number 3: 581-06031C102J; TempCo: X7R; Supplier 3: Mouser; Published: 2008-06-19; RoHS: Y; MountType: SMT; Supplier 1: Digi-Key; PackageReference: 0603; Tolerance_%: 5%; LatestRevisionDate: 2017-03-09; PartNumber: 06031C102JAT2A; AEC Qualified: N; VDC_V: 100V; ComponentLink1Description: Datasheet link; AEC Grade: N/A; Supplier Part Number 1: 478-3698-1-ND; Technology: Ceramic; ValueDisplayed: 1000pF; ComponentLink1URL: http://datasheets.avx.com/X7RDielectric.pdf; Origin Footprint: 0603; DesignItemID: CMP-0006723-4; LibraryName: Altium Vault - TI; FootprintName: 0603S
C36 = CMP-0006723-4: CAP, CERM, 1000 pF, 100 V, +/- 5%, X7R, 0603; Manufacturer: AVX; TaMin_C: -55癈; ESR_ohm: 2.76d; Polarized: N; SizeAreaWB_mm2: 4.68; Value1: 0.276 ohm; U/M: EA; Value: 1000pF; TaMax_C: 125癈; SizeZ_mm: 1; SizeX_mm: 1.6; SizeY_mm: 0.8; Cap_Case: 0603; Value2: 100V; SizeArea_mm2: 1.28; CompType: Capacitor; AEC Category: Q200; OriginFootprint 2: 0603_HV; OriginFootprint 3: 0603L; OriginFootprint 4: 0603M; UniqueId: 3db1f6a400993974; AddInBom: yes; Device: CMP-0006723-4; Symbol: CMP-0006723-4; Supplier Part Number 2: 96M1234; Publisher: Texas Instruments; Supplier 2: Newark; Supplier Part Number 3: 581-06031C102J; TempCo: X7R; Supplier 3: Mouser; Published: 2008-06-19; RoHS: Y; MountType: SMT; Supplier 1: Digi-Key; PackageReference: 0603; Tolerance_%: 5%; LatestRevisionDate: 2017-03-09; PartNumber: 06031C102JAT2A; AEC Qualified: N; VDC_V: 100V; ComponentLink1Description: Datasheet link; AEC Grade: N/A; Supplier Part Number 1: 478-3698-1-ND; Technology: Ceramic; ValueDisplayed: 1000pF; ComponentLink1URL: http://datasheets.avx.com/X7RDielectric.pdf; Origin Footprint: 0603; DesignItemID: CMP-0006723-4; LibraryName: Altium Vault - TI; FootprintName: 0603S
C37 = CMP-0007185-4: CAP, CERM, 150 pF, 50 V, +/- 5%, C0G/NP0, 0603; Manufacturer: MuRata; TaMin_C: -55癈; Polarized: N; SizeAreaWB_mm2: 4.68; Value1: Unknown; U/M: EA; Value: 150pF; TaMax_C: 125癈; SizeZ_mm: 1; SizeX_mm: 1.6; SizeY_mm: 0.8; Cap_Case: 0603; Value2: 50V; SizeArea_mm2: 1.28; CompType: Capacitor; AEC Category: Q200; OriginFootprint 2: 0603_HV; OriginFootprint 3: 0603L; OriginFootprint 4: 0603M; UniqueId: ff078052695da6b6; AddInBom: yes; Device: CMP-0007185-4; Symbol: CMP-0007185-4; Supplier Part Number 2: 81-GRM39C151J50; Publisher: Texas Instruments; Supplier 2: Mouser; Supplier Part Number 3: 8819874; TempCo: C0G/NP0; Supplier 3: Farnell; Published: 2008-06-19; RoHS: Y; MountType: SMT; Supplier 1: Digi-Key; PackageReference: 0603; Tolerance_%: 5%; LatestRevisionDate: 2017-03-09; PartNumber: GRM1885C1H151JA01D; AEC Qualified: ?; Cap_F: 150pF; VDC_V: 50V; ComponentLink1Description: Datasheet link; Supplier Part Number 1: 490-1431-1-ND; Technology: Ceramic; ComponentLink1URL: http://search.murata.co.jp/Ceramy/PnsearchViewAction.do?HnOFG=ON&HnNFG=ON&SEL_CNT=50&sLang=en&sKey=GRM1885C1H151JA01D&x=9&y=9&search=startwith; Origin Footprint: 0603; DesignItemID: CMP-0007185-4; LibraryName: Altium Vault - TI; FootprintName: 0603S
C38 = CMP-0007468-5: CAP, CERM, 0.01 uF, 100 V, +/- 10%, X7R, 0603; Manufacturer: MuRata; TaMin_C: -55癈; Polarized: N; SizeAreaWB_mm2: 4.68; Value1: Unknown; U/M: EA; Value: 0.01uF; TaMax_C: 125癈; SizeZ_mm: 1; SizeX_mm: 1.6; SizeY_mm: 0.8; Cap_Case: 0603; Value2: 100V; SizeArea_mm2: 1.28; CompType: Capacitor; AEC Category: Q200; OriginFootprint 2: 0603_HV; OriginFootprint 3: 0603L; OriginFootprint 4: 0603M; UniqueId: 6827ca7a6bd67e26; AddInBom: yes; Device: CMP-0007468-5; Symbol: CMP-0007468-5; Supplier Part Number 2: 81-GRM188R72A103KA1D; Publisher: Texas Instruments; Supplier 2: Mouser; TempCo: X7R; Published: 2008-06-19; RoHS: Y; MountType: SMT; Supplier 1: Digi-Key; PackageReference: 0603; Tolerance_%: 10%; LatestRevisionDate: 2017-03-09; PartNumber: GRM188R72A103KA01D; AEC Qualified: ?; VDC_V: 100V; ComponentLink1Description: Datasheet link; Supplier Part Number 1: GRM188R72A103KA01D-ND; Technology: Ceramic; ValueDisplayed: 0.01uF; ComponentLink1URL: http://search.murata.co.jp/Ceramy/PnsearchViewAction.do?HnOFG=ON&HnNFG=ON&SEL_CNT=50&sLang=en&sKey=GRM188R72A103KA01D&x=9&y=9&search=startwith; Origin Footprint: 0603; DesignItemID: CMP-0007468-5; LibraryName: Altium Vault - TI; FootprintName: 0603S
C39 = CMP-0007468-5: CAP, CERM, 0.01 uF, 100 V, +/- 10%, X7R, 0603; Manufacturer: MuRata; TaMin_C: -55癈; Polarized: N; SizeAreaWB_mm2: 4.68; Value1: Unknown; U/M: EA; Value: 0.01uF; TaMax_C: 125癈; SizeZ_mm: 1; SizeX_mm: 1.6; SizeY_mm: 0.8; Cap_Case: 0603; Value2: 100V; SizeArea_mm2: 1.28; CompType: Capacitor; AEC Category: Q200; OriginFootprint 2: 0603_HV; OriginFootprint 3: 0603L; OriginFootprint 4: 0603M; UniqueId: 54d3d224326b3f8f; AddInBom: yes; Device: CMP-0007468-5; Symbol: CMP-0007468-5; Supplier Part Number 2: 81-GRM188R72A103KA1D; Publisher: Texas Instruments; Supplier 2: Mouser; TempCo: X7R; Published: 2008-06-19; RoHS: Y; MountType: SMT; Supplier 1: Digi-Key; PackageReference: 0603; Tolerance_%: 10%; LatestRevisionDate: 2017-03-09; PartNumber: GRM188R72A103KA01D; AEC Qualified: ?; VDC_V: 100V; ComponentLink1Description: Datasheet link; Supplier Part Number 1: GRM188R72A103KA01D-ND; Technology: Ceramic; ValueDisplayed: 0.01uF; ComponentLink1URL: http://search.murata.co.jp/Ceramy/PnsearchViewAction.do?HnOFG=ON&HnNFG=ON&SEL_CNT=50&sLang=en&sKey=GRM188R72A103KA01D&x=9&y=9&search=startwith; Origin Footprint: 0603; DesignItemID: CMP-0007468-5; LibraryName: Altium Vault - TI; FootprintName: 0603S
C40 = CMP-0007468-5: CAP, CERM, 0.01 uF, 100 V, +/- 10%, X7R, 0603; Manufacturer: MuRata; TaMin_C: -55癈; Polarized: N; SizeAreaWB_mm2: 4.68; Value1: Unknown; U/M: EA; Value: 0.01uF; TaMax_C: 125癈; SizeZ_mm: 1; SizeX_mm: 1.6; SizeY_mm: 0.8; Cap_Case: 0603; Value2: 100V; SizeArea_mm2: 1.28; CompType: Capacitor; AEC Category: Q200; OriginFootprint 2: 0603_HV; OriginFootprint 3: 0603L; OriginFootprint 4: 0603M; UniqueId: 12af2948e5a85261; AddInBom: yes; Device: CMP-0007468-5; Symbol: CMP-0007468-5; Supplier Part Number 2: 81-GRM188R72A103KA1D; Publisher: Texas Instruments; Supplier 2: Mouser; TempCo: X7R; Published: 2008-06-19; RoHS: Y; MountType: SMT; Supplier 1: Digi-Key; PackageReference: 0603; Tolerance_%: 10%; LatestRevisionDate: 2017-03-09; PartNumber: GRM188R72A103KA01D; AEC Qualified: ?; VDC_V: 100V; ComponentLink1Description: Datasheet link; Supplier Part Number 1: GRM188R72A103KA01D-ND; Technology: Ceramic; ValueDisplayed: 0.01uF; ComponentLink1URL: http://search.murata.co.jp/Ceramy/PnsearchViewAction.do?HnOFG=ON&HnNFG=ON&SEL_CNT=50&sLang=en&sKey=GRM188R72A103KA01D&x=9&y=9&search=startwith; Origin Footprint: 0603; DesignItemID: CMP-0007468-5; LibraryName: Altium Vault - TI; FootprintName: 0603S
C41 = CMP-0007468-5: CAP, CERM, 0.01 uF, 100 V, +/- 10%, X7R, 0603; Manufacturer: MuRata; TaMin_C: -55癈; Polarized: N; SizeAreaWB_mm2: 4.68; Value1: Unknown; U/M: EA; Value: 0.01uF; TaMax_C: 125癈; SizeZ_mm: 1; SizeX_mm: 1.6; SizeY_mm: 0.8; Cap_Case: 0603; Value2: 100V; SizeArea_mm2: 1.28; CompType: Capacitor; AEC Category: Q200; OriginFootprint 2: 0603_HV; OriginFootprint 3: 0603L; OriginFootprint 4: 0603M; UniqueId: c9655d0faea7d93e; AddInBom: yes; Device: CMP-0007468-5; Symbol: CMP-0007468-5; Supplier Part Number 2: 81-GRM188R72A103KA1D; Publisher: Texas Instruments; Supplier 2: Mouser; TempCo: X7R; Published: 2008-06-19; RoHS: Y; MountType: SMT; Supplier 1: Digi-Key; PackageReference: 0603; Tolerance_%: 10%; LatestRevisionDate: 2017-03-09; PartNumber: GRM188R72A103KA01D; AEC Qualified: ?; VDC_V: 100V; ComponentLink1Description: Datasheet link; Supplier Part Number 1: GRM188R72A103KA01D-ND; Technology: Ceramic; ValueDisplayed: 0.01uF; ComponentLink1URL: http://search.murata.co.jp/Ceramy/PnsearchViewAction.do?HnOFG=ON&HnNFG=ON&SEL_CNT=50&sLang=en&sKey=GRM188R72A103KA01D&x=9&y=9&search=startwith; Origin Footprint: 0603; DesignItemID: CMP-0007468-5; LibraryName: Altium Vault - TI; FootprintName: 0603S
C43 C44 = MA63V100M10X10: 容值:100uF;精度:±20%;额定电压:63V;纹波电流:3.1A@100kHz;等效串联电阻(ESR):30mΩ@100kHz;类型:聚合物;; Manufacturer: JIERR(捷而瑞); AddInBom: yes; Tolerance: ±20%; Voltage Rating: 63V; Type: 聚合物; Lifetime: 2000hrs@105℃; Polarity type: 有极性; Symbol: MA63V100M10X10; Device: MA63V100M10X10; LCSC Part Name: 100uF ±20% 63V; SupplierPart: C54321630; ManufacturerPart: MA63V100M10X10; Supplier Footprint: SMD,D10.3xL10.5mm; JLCPCB Part Class: Extended Part; Datasheet: https://item.szlcsc.com/datasheet/MA63V100M10X10/57612373.html; Supplier: LCSC; ConvertToPcb: yes; FootprintName: CAP-SMD_BD10.0-L10.3-W10.3-LS11.6-FD_H10.5; Value: 100uF; Ripple Current: 3.1A@100kHz; Equivalent Series Resistance(ESR): 30mΩ@100kHz; Diameter: 10mm; Height - Seated (Max): 10mm; Operating Temperature: -55℃~+105℃
D1 D2 = DIODE_SMD_SCHOTTKY_B560C: DIODE, SCHOTTKY, 40V, 3A; MANF: DIODES; MANF_P#: B560C-13-F; DESC: DESCRIPTION; PARAM2: 5A; PARAM: 60V; ASSEMBLY: ASSEMBLY; PRICE: PRICE; VALUE: B560C
D3 D4 = DIODE_SMD_SCHOTTKY_PMEG6010: DIODE, SCHOTTKY, 60V, 1A; MANF: NEXPERIA; MANF_P#: PMEG6010AESB; DESC: DESCRIPTION; PARAM2: 60Vrrm, 0.6Vf; PARAM: 1A, -65~150oC; ASSEMBLY: ASSEMBLY; PRICE: 0.4$; VALUE: PMEG6010
H1 = HDR-M_2.54_1x12P: 间距:2.54mm;总PIN位数:12;排数:1;插针结构:1x12P;行距:-;安装类型:直插;圆针/方针:方针;额定电流:3A;额定电压:250V;配合针长度:6mm;塑高:2.5mm;端接针长度:3mm;触头材质:-;工作温度范围:-40℃~+105℃;颜色:黑色;; Symbol: HDR_2.54-1x12P; ConvertToPcb: yes; ModelId: 3dba4cf9b1d14f4b93786901a7682825聨0819f05c4eef4c71ace90d822a990e87; ModelName: HDR2.54-M-LI-1X12P; ModelTransform: 1199.998,100,0,0,0,0,0,0,-118.11; Device: HDR-M_2.54_1x12P; AddInBom: yes; SupplierPart: C2840012; Supplier Footprint: 插件; FootprintName: HDR-TH_12P-P2.54-V-M
J1 J3 = CMP-0055387-2: Standard Banana Jack, Uninsulated, 15A; Manufacturer: Cinch Connectivity; CNHeader: FALSE; Green_Lifecycle: Active; Green_REACh: Passed; CT: TRUE; UniqueId: 51bfc0e5166a1c40; AddInBom: yes; OriginModelName: Johnson_108-0740-001; Device: CMP-0055387-2; Symbol: CMP-0055387-2; Supplier Part Number 2: 530-108-0740-1; Publisher: Texas Instruments; Supplier 2: Mouser; RoHS: Y; MountType: TH; Green_EU RoHS-2: Passed; Supplier 1: Digi-Key; Green_EU RoHS: Passed with Exemption; PackageReference: Banana Jack; CompType: Banana Jack; LatestRevisionDate: 26/05/2017; PartNumber: 108-0740-001; ComponentLink1Description: Datasheet URL; Supplier Part Number 1: J147-ND; ComponentLink1URL: http://emersonnetworkpower.com/webapp/wcs/stores/servlet/ESC/resources/1080740001.pdf; DesignItemID: CMP-0055387-2; LibraryName: Altium Vault - TI; FootprintName: Johnson_108-0740-001
J2 = CMP-0055387-2_1: Standard Banana Jack, Uninsulated, 15A; Manufacturer: Cinch Connectivity; CNHeader: FALSE; Green_Lifecycle: Active; Green_REACh: Passed; CT: TRUE; UniqueId: 1fb9863844ab5169; AddInBom: yes; OriginModelName: Johnson_108-0740-001; Device: CMP-0055387-2_1; Symbol: CMP-0055387-2; Supplier Part Number 2: 530-108-0740-1; Publisher: Texas Instruments; Supplier 2: Mouser; RoHS: Y; MountType: TH; Green_EU RoHS-2: Passed; Supplier 1: Digi-Key; Green_EU RoHS: Passed with Exemption; PackageReference: Banana Jack; CompType: Banana Jack; LatestRevisionDate: 26/05/2017; PartNumber: 108-0740-001; ComponentLink1Description: Datasheet URL; Supplier Part Number 1: J147-ND; ComponentLink1URL: http://emersonnetworkpower.com/webapp/wcs/stores/servlet/ESC/resources/1080740001.pdf; DesignItemID: CMP-0055387-2; LibraryName: Altium Vault - TI; FootprintName: Johnson_108-0740-001
J4 = CMP-0055387-2_1: Standard Banana Jack, Uninsulated, 15A; Manufacturer: Cinch Connectivity; CNHeader: FALSE; Green_Lifecycle: Active; Green_REACh: Passed; CT: TRUE; UniqueId: 7aadee231938cadd; AddInBom: yes; OriginModelName: Johnson_108-0740-001; Device: CMP-0055387-2_1; Symbol: CMP-0055387-2; Supplier Part Number 2: 530-108-0740-1; Publisher: Texas Instruments; Supplier 2: Mouser; RoHS: Y; MountType: TH; Green_EU RoHS-2: Passed; Supplier 1: Digi-Key; Green_EU RoHS: Passed with Exemption; PackageReference: Banana Jack; CompType: Banana Jack; LatestRevisionDate: 26/05/2017; PartNumber: 108-0740-001; ComponentLink1Description: Datasheet URL; Supplier Part Number 1: J147-ND; ComponentLink1URL: http://emersonnetworkpower.com/webapp/wcs/stores/servlet/ESC/resources/1080740001.pdf; DesignItemID: CMP-0055387-2; LibraryName: Altium Vault - TI; FootprintName: Johnson_108-0740-001
J5 = CMP-0054801-2: Header, 2.54 mm, 6x1, Gold, TH; Manufacturer: Wurth Elektronik; Cert_UL: Y; Gender: Male; Row_Count: 1; Shrouded: N; Pitch_mm: 2.54; UniqueId: 188f82074eb8ca32; AddInBom: yes; Device: CMP-0054801-2; Symbol: CMP-0054801-2; RoHS: Y; CompType: Header; Supplier Part Number 2: 20X0957; Supplier 1: Digi-Key; PinCount: 6; Color: Black; PartNumber: 61300611121; Supplier 3: Mouser; ComponentLink1URL: http://katalog.we-online.de/em/datasheet/6130xx11121.pdf; ContactFinish: Gold; MountType: TH; Supplier Part Number 3: 710-61300611121; PackageReference: Header, 2.54mm, 6x1, TH; Supplier Part Number 1: 732-5319-ND; ClassName: Header; Supplier 2: Newark; Orientation: Vertical; ComponentLink1Description: Datasheet URL; DesignItemID: CMP-0054801-2; LibraryName: Altium Vault - TI; FootprintName: WURTH_61300611121; OriginModelName: 61300611121
J6 = CMP-0054801-2_1: Header, 2.54 mm, 6x1, Gold, TH; Manufacturer: Wurth Elektronik; Cert_UL: Y; Gender: Male; Row_Count: 1; Shrouded: N; Pitch_mm: 2.54; UniqueId: be1703a8306ee88a; AddInBom: yes; Device: CMP-0054801-2_1; Symbol: CMP-0054801-2; RoHS: Y; CompType: Header; Supplier Part Number 2: 20X0957; Supplier 1: Digi-Key; PinCount: 6; Color: Black; PartNumber: 61300611121; Supplier 3: Mouser; ComponentLink1URL: http://katalog.we-online.de/em/datasheet/6130xx11121.pdf; ContactFinish: Gold; MountType: TH; Supplier Part Number 3: 710-61300611121; PackageReference: Header, 2.54mm, 6x1, TH; Supplier Part Number 1: 732-5319-ND; ClassName: Header; Supplier 2: Newark; Orientation: Vertical; ComponentLink1Description: Datasheet URL; DesignItemID: CMP-0054801-2; LibraryName: Altium Vault - TI; FootprintName: WURTH_61300611121; OriginModelName: 61300611121
J10 = CMP-0054794-2: Header, 2.54 mm, 2x1, Gold, TH; Manufacturer: Wurth Elektronik; Shrouded: N; Gender: Male; Green_REACh: Passed; Pitch_mm: 2.54; Green_Lifecycle: Active; Row_Count: 1; Cert_UL: Y; UniqueId: 19810ed2731c20b4; AddInBom: yes; Device: CMP-0054794-2; Symbol: CMP-0054794-2; Supplier Part Number 2: 20X0948; Orientation: Vertical; PinCount: 2; ClassName: Header; Supplier 2: Newark; PackageReference: Header, 2.54mm, 2x1, TH; CompType: Header; ComponentLink1Description: Datasheet URL; Supplier 1: Digi-Key; Green_EU RoHS-2: Incomplete; ComponentLink1URL: http://katalog.we-online.de/em/datasheet/6130xx11121.pdf; Green_EU RoHS: Passed; MountType: TH; Supplier Part Number 3: 710-61300211121; RoHS: Y; Supplier Part Number 1: 732-5315-ND; ContactFinish: Gold; Supplier 3: Mouser; PartNumber: 61300211121; Color: Black; DesignItemID: CMP-0054794-2; LibraryName: Altium Vault - TI; FootprintName: WURTH_61300211121; OriginModelName: 61300211121
JP1 = CMP-0054796-4: Header, 2.54 mm, 3x1, Gold, TH; Manufacturer: Wurth Elektronik; Green_Lifecycle: Active; Green_REACh: Passed; CT: FALSE; CNHeader: TRUE; UniqueId: 4fe8deccf3ecd12b; AddInBom: yes; Device: CMP-0054796-4; Symbol: CMP-0054796-4; MountType: TH; Supplier Part Number 1: 732-5316-ND; ClassName: Header; Supplier Part Number 3: 356154; ComponentLink1Description: Datasheet URL; ComponentLink1URL: http://katalog.we-online.de/em/datasheet/6130xx11121.pdf; PackageReference: Header, 2.54mm, 3x1, TH; Supplier Part Number 2: 20X0950; Green_EU RoHS-2: Incomplete; CompType: Header; Green_EU RoHS: Passed; RoHS: Y; PartNumber: 61300311121; Supplier 2: Newark; Supplier 1: Digi-Key; Supplier 3: Farnell; Publisher: Texas Instruments; LatestRevisionDate: 26/05/2017; DesignItemID: CMP-0054796-4; LibraryName: Altium Vault - TI; FootprintName: WURTH_61300311121; OriginModelName: 61300311121
JP2 JP7 = CMP-0054796-4: Header, 2.54 mm, 3x1, Gold, TH; Manufacturer: Wurth Elektronik; Green_Lifecycle: Active; Green_REACh: Passed; CT: FALSE; CNHeader: TRUE; AddInBom: yes; Device: CMP-0054796-4; Symbol: CMP-0054796-4; MountType: TH; Supplier Part Number 1: 732-5316-ND; ClassName: Header; Supplier Part Number 3: 356154; ComponentLink1Description: Datasheet URL; ComponentLink1URL: http://katalog.we-online.de/em/datasheet/6130xx11121.pdf; PackageReference: Header, 2.54mm, 3x1, TH; Supplier Part Number 2: 20X0950; Green_EU RoHS-2: Incomplete; CompType: Header; Green_EU RoHS: Passed; RoHS: Y; PartNumber: 61300311121; Supplier 2: Newark; Supplier 1: Digi-Key; Supplier 3: Farnell; Publisher: Texas Instruments; LatestRevisionDate: 26/05/2017; DesignItemID: CMP-0054796-4; LibraryName: Altium Vault - TI; Origin 3D Model Title: 61300311121; FootprintName: WURTH_61300311121
JP5 = CMP-0054796-4: Header, 2.54 mm, 3x1, Gold, TH; Manufacturer: Wurth Elektronik; Green_Lifecycle: Active; Green_REACh: Passed; CT: FALSE; CNHeader: TRUE; UniqueId: 7ff5f6d6ea161ff3; AddInBom: yes; Device: CMP-0054796-4; Symbol: CMP-0054796-4; MountType: TH; Supplier Part Number 1: 732-5316-ND; ClassName: Header; Supplier Part Number 3: 356154; ComponentLink1Description: Datasheet URL; ComponentLink1URL: http://katalog.we-online.de/em/datasheet/6130xx11121.pdf; PackageReference: Header, 2.54mm, 3x1, TH; Supplier Part Number 2: 20X0950; Green_EU RoHS-2: Incomplete; CompType: Header; Green_EU RoHS: Passed; RoHS: Y; PartNumber: 61300311121; Supplier 2: Newark; Supplier 1: Digi-Key; Supplier 3: Farnell; Publisher: Texas Instruments; LatestRevisionDate: 26/05/2017; DesignItemID: CMP-0054796-4; LibraryName: Altium Vault - TI; FootprintName: WURTH_61300311121; OriginModelName: 61300311121
JP6 = CMP-0084909-1: Header, 2.54mm, 5x1, Gold, TH; Manufacturer: Wurth Elektronik; Pitch_mm: 2.54; Current_A: 3A; Shrouded: N; Gender: Male; Voltage_V: 250V; Row_Count: 1; UniqueId: 1e4a53fbbd604e66; AddInBom: yes; Device: CMP-0084909-1; Symbol: CMP-0084909-1; MountType: TH; PinCount: 5; Color: Black; ClassName: Header; ContactFinish: Gold; ComponentLink1Description: Datasheet URL; ComponentLink1URL: https://katalog.we-online.de/em/datasheet/6130xx11121.pdf; PackageReference: Header, 2.54mm, 5x1, TH; CompType: Header; Orientation: Vertical; RoHS: Y; PartNumber: 61300511121; DesignItemID: CMP-0084909-1; LibraryName: Altium Vault - TI; FootprintName: Wurth_61300511121; OriginModelName: 61300511121
L1 = CMP-0063502-1: Manufacturer: Vishay-Dale; PartNumber: IHLP5050FDER1R8M01; Isat: 41A @ 20% inductance drop; Irms: 24A @ 40C rise; Green_Lifecycle: Active; SizeAreaWB_mm2: 226.48; DCR_ohm: 3.2m; Green_REACh: Passed; Value1: 0.0032 ohm; Material: Powdered Iron; Value: 2.8uH; Imax_A: 24A; SizeZ_mm: 6.5; SizeX_mm: 13.2; SizeY_mm: 12.9; SizeArea_mm2: 170.28; CompType: Inductor; Ind_H: 1.8礖; AEC Category: Q200; UniqueId: d450ceac7adb81c3; AddInBom: yes; Device: CMP-0063502-1; Symbol: CMP-0063502-1; ComponentLink1URL: http://www.vishay.com/docs/34123/lp50fd01.pdf; Publisher: Texas Instruments; Published: 2008-06-26; RoHS: Y; MountType: SMT; Green_EU RoHS-2: Passed; Supplier 1: Digi-Key; Green_EU RoHS: Passed; PackageReference: IHLP-5050FD; Value2: 24A; LatestRevisionDate: 2017-06-02; AEC Qualified: ?; ComponentLink1Description: Datasheet link; Supplier Part Number 1: IHLP5050FDER1R8M01-ND; Technology: Shielded; DesignItemID: CMP-0063502-1; LibraryName: Altium Vault - TI; FootprintName: IHLP-5050FD
Q1-Q4 = NCEP0178AK: 数量:1个N沟道;漏源电压(Vdss):100V;连续漏极电流(Id):78A;导通电阻(RDS(on)):12mΩ@4.5V;耗散功率(Pd):125W;阈值电压(Vgs(th)):2.2V;; Manufacturer: NCE(无锡新洁能); AddInBom: yes; ModelId: 6b2ea0154a284e6db98f69bccdba3606聨0819f05c4eef4c71ace90d822a990e87; ModelName: TO-252-2_L6.5-W6.1-H2.3-LS10.0-P4.58; ModelTransform: 255.905,390.52442,0,270,0,0,38.183,0.432,0; Number: 1个N沟道; Drain to Source Voltage: 100V; Current - Continuous Drain(Id): 78A; Pd - Power Dissipation: 125W; Gate Threshold Voltage (Vgs(th)): 2.2V; Gate Charge(Qg): 65nC@10V; Input Capacitance(Ciss): 5.48nF; Reverse Transfer Capacitance (Crss@Vds): 30pF; Type: N沟道; Output Capacitance(Coss): 425pF; Vgs: ±20V; Symbol: NCEP0178AK; Device: NCEP0178AK; LCSC Part Name: 1个N沟道 耐压:100V 电流:78A; SupplierPart: C216784; ManufacturerPart: NCEP0178AK; Supplier Footprint: TO-252-2L; JLCPCB Part Class: Extended Part; Datasheet: https://item.szlcsc.com/datasheet/NCEP0178AK/217675.html; Supplier: LCSC; ConvertToPcb: yes; FootprintName: TO-252-2_L6.5-W6.1-P4.58-LS10.0-TL; RDS(on): 12mΩ@4.5V; Operating Temperature: -55℃~+175℃; Configuration: -
R1 = CMP-0023259-5: RES, 71.5 k, 1%, 0.1 W, 0603; Manufacturer: Yageo; Power_W: 100mW; TempCo: 100 ppm/C; Value_Code: 71k5; Value: 71.5k; EIA_Code: E96; SizeX_mm: 1.6; SizeY_mm: 0.8; SizeZ_mm: 1; Value2: 0.1W; SizeArea_mm2: 1.28; CompType: Resistor; AEC Qualified: N; VDC_V: 75V; AEC Category: Q200; SizeAreaWB_mm2: 4.68; Origin Footprint: 0603; OriginFootprint 2: 0603_HV; OriginFootprint 3: 0603L; OriginFootprint 4: 0603M; UniqueId: 353b166cc2dee846; AddInBom: yes; Device: CMP-0023259-5; Symbol: CMP-0023259-5; Supplier Part Number 2: 603-RC0603FR-0771K5L; Supplier 2: Mouser; RoHS: Y; Value1: 1%; MountType: SMT; Supplier 1: Digi-Key; PackageReference: 0603; Tolerance_%: 1%; Res_ohm: 71.5k; PartNumber: RC0603FR-0771K5L; ComponentLink1Description: Datasheet link; Supplier Part Number 1: 311-71.5KHRCT-ND; Technology: Thick Film; ComponentLink1URL: http://www.yageo.com/pdf/Pu-RC0603_51_PbFree_L_2.pdf; AEC Grade: N/A; DesignItemID: CMP-0023259-5; LibraryName: Altium Vault - TI; FootprintName: 0603S